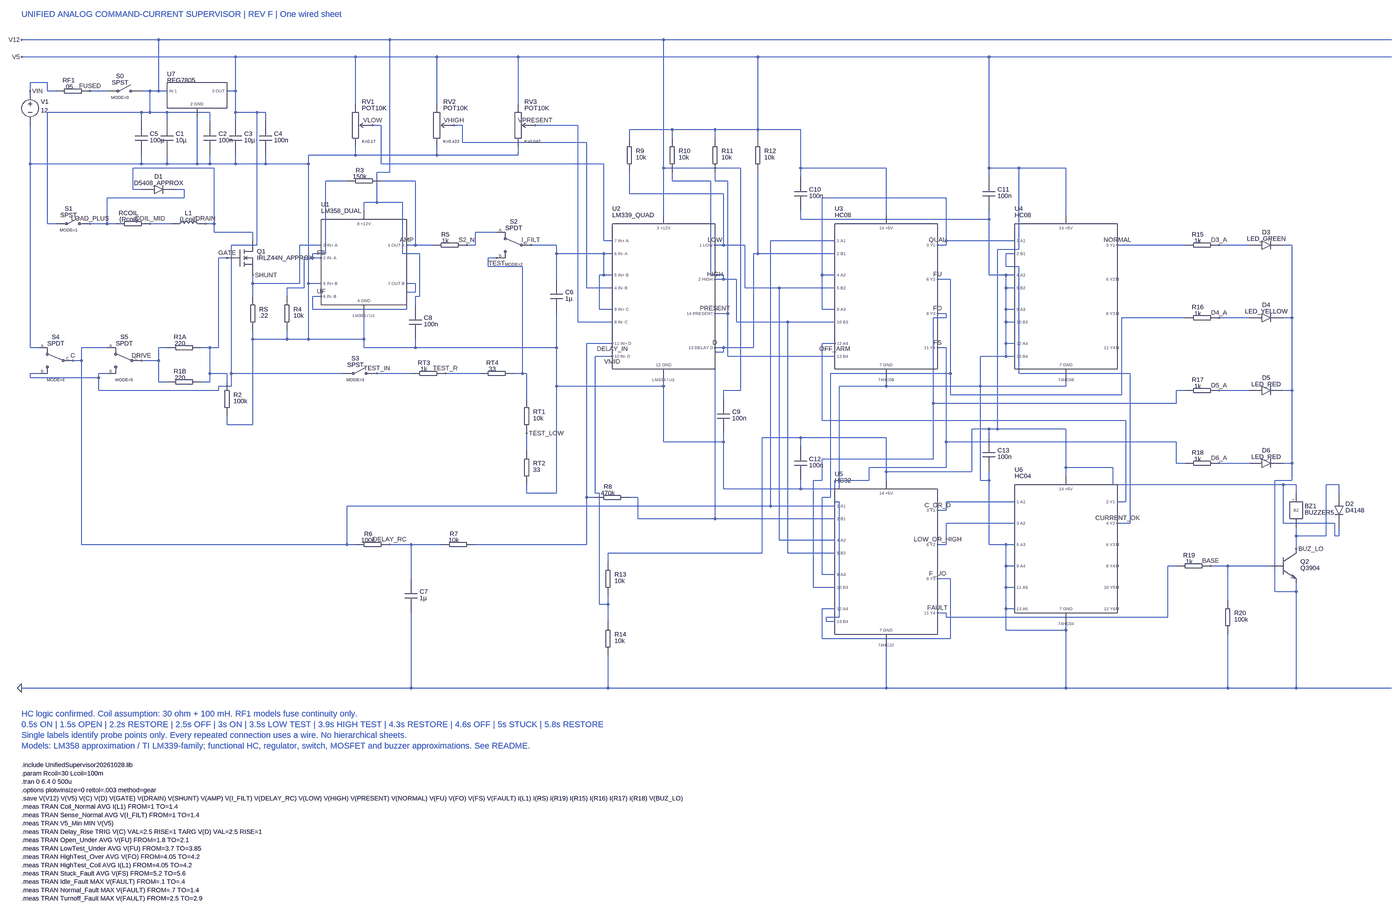
[diagram p0: schematic Unified_Supervisor.asc, whole sheet]
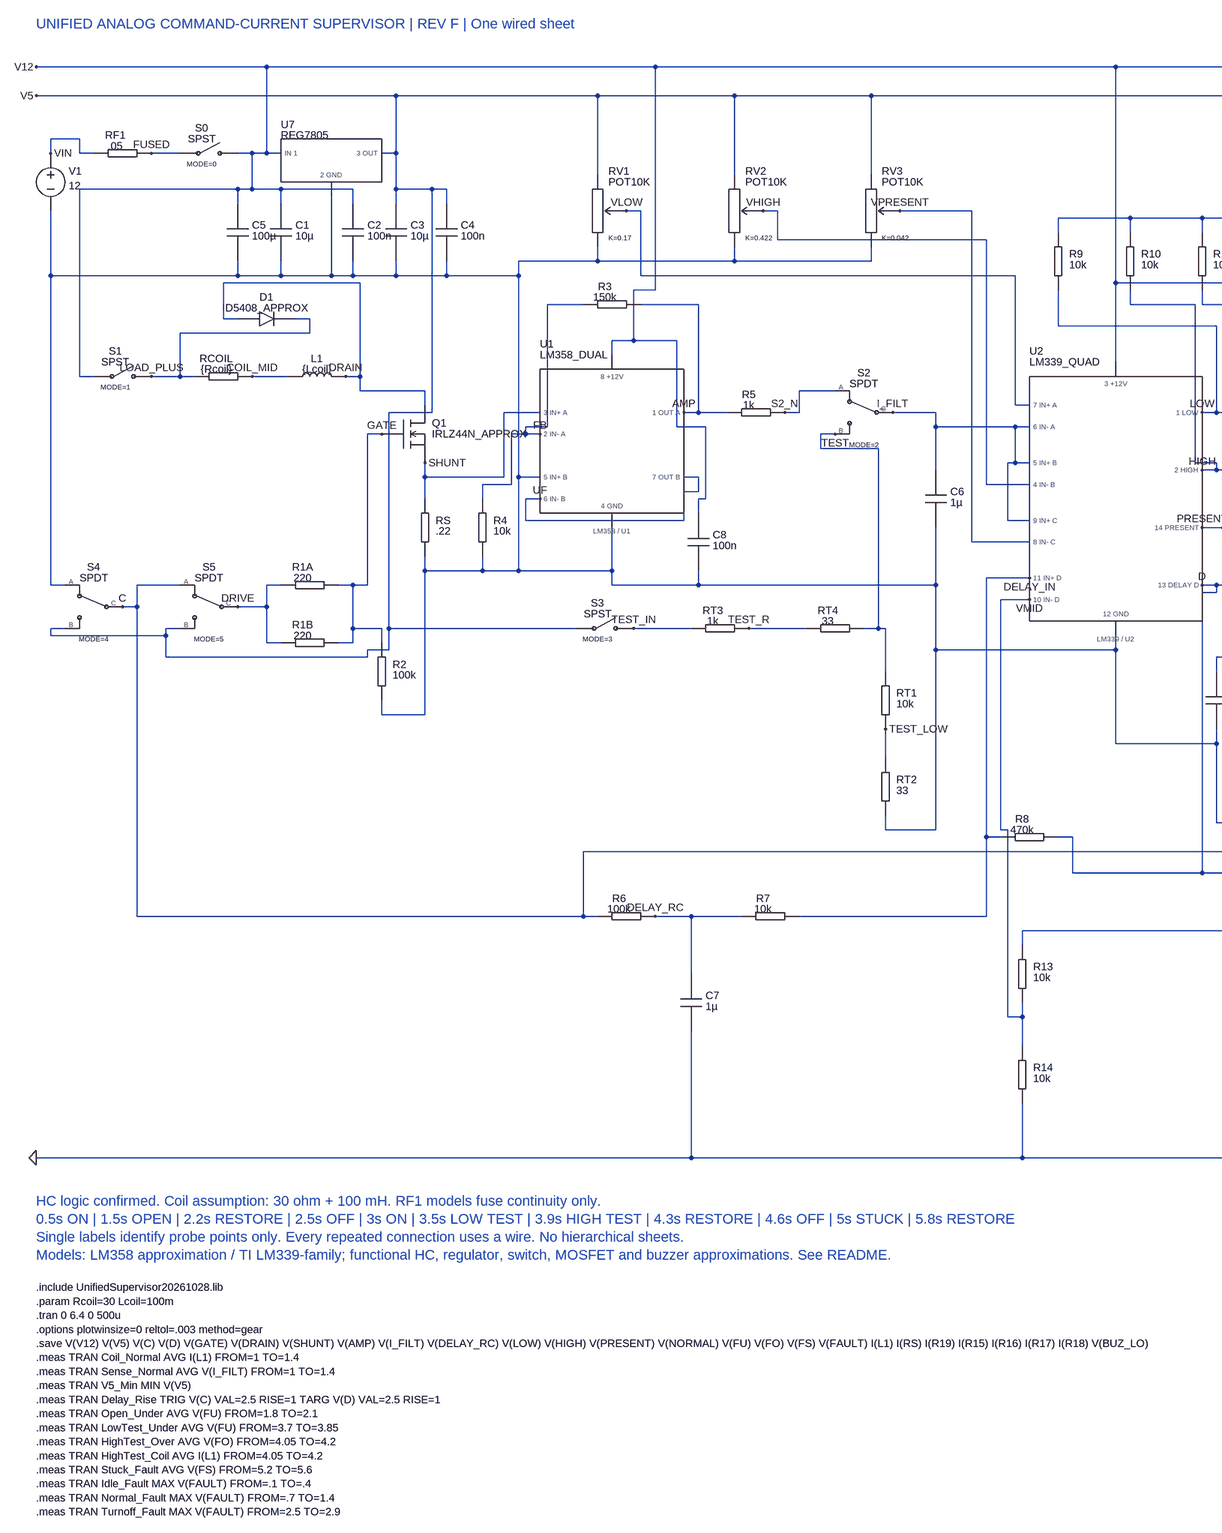
[diagram p1: schematic Unified_Supervisor.asc, part, row 1 of 1, column 1 of 2]
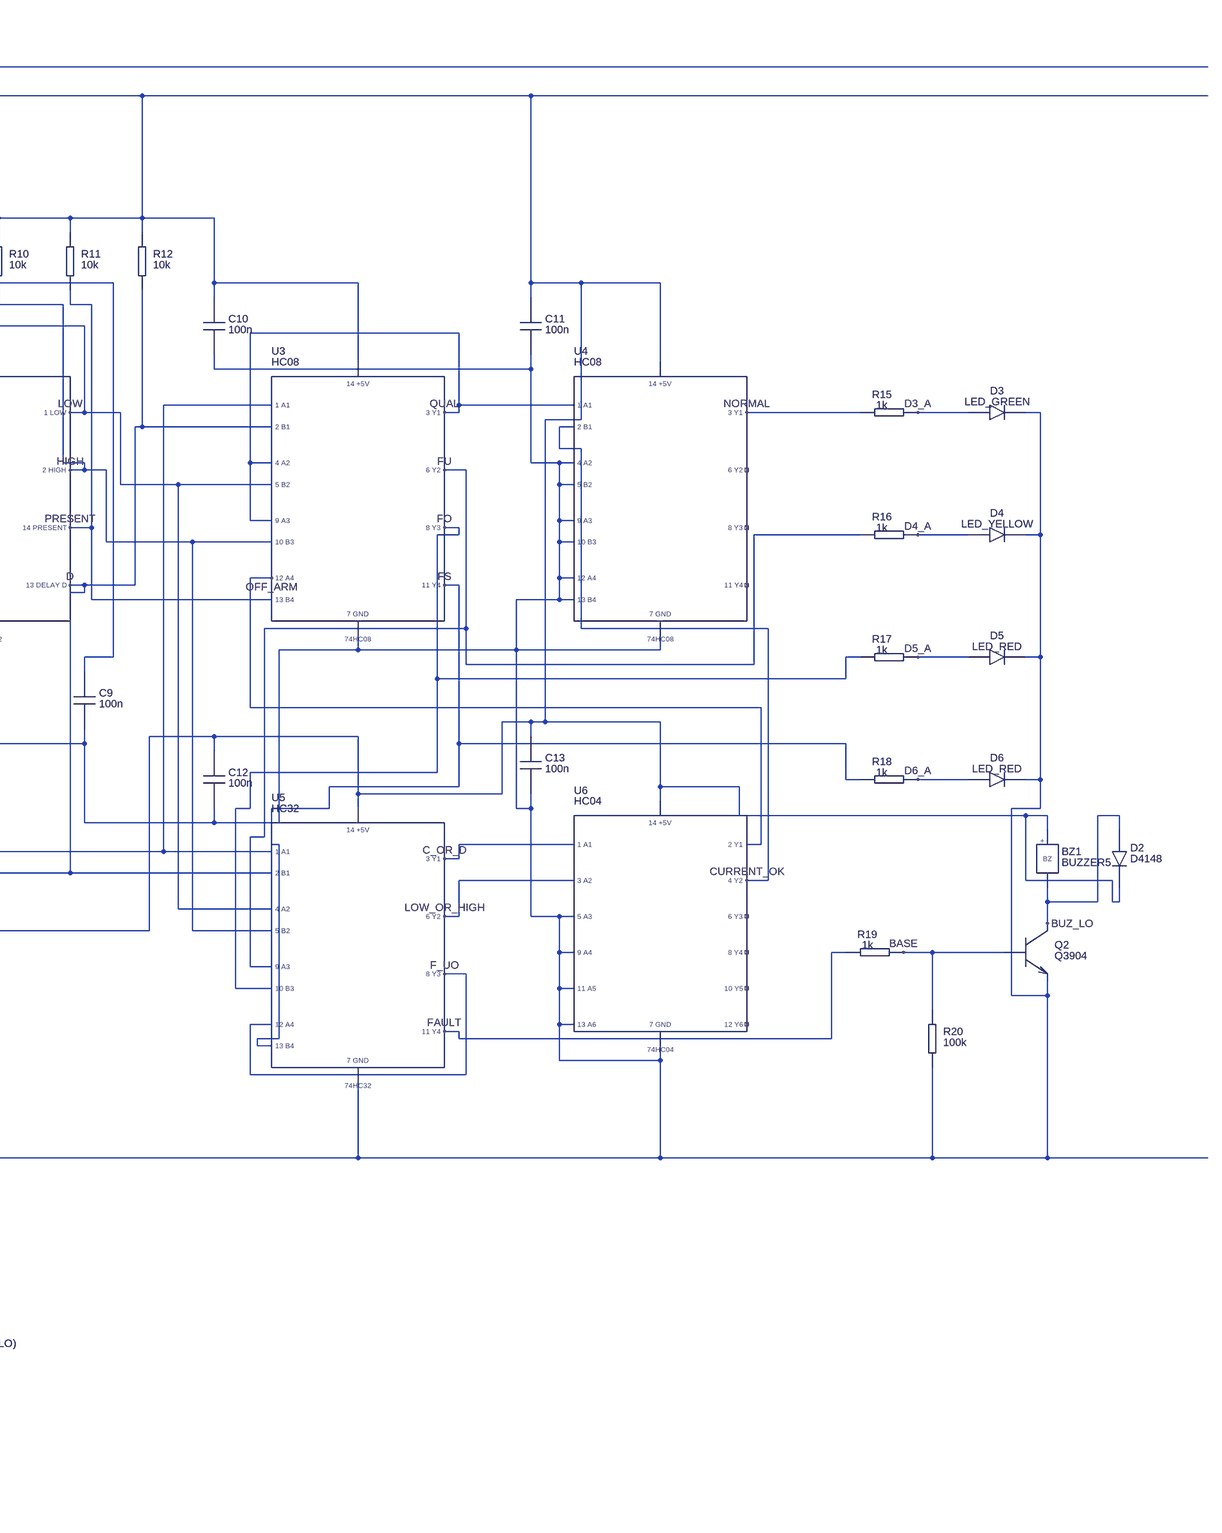
[diagram p2: schematic Unified_Supervisor.asc, part, row 1 of 1, column 2 of 2]
Unified_Supervisor.asc, the LTspice schematic file:
Version 4
SHEET 1 5280 3280
WIRE 544 96 32 96
WIRE 1408 96 544 96
WIRE 2432 96 1408 96
WIRE 5168 96 2432 96
WIRE 832 160 32 160
WIRE 1280 160 832 160
WIRE 1584 160 1280 160
WIRE 1888 160 1584 160
WIRE 2784 160 1888 160
WIRE 3648 160 2784 160
WIRE 5168 160 3648 160
WIRE 128 256 64 256
WIRE 64 288 64 256
WIRE 128 288 128 256
WIRE 160 288 128 288
WIRE 352 288 288 288
WIRE 512 288 480 288
WIRE 544 288 544 96
WIRE 544 288 512 288
WIRE 576 288 544 288
WIRE 832 288 832 160
WIRE 832 288 800 288
WIRE 1280 336 1280 160
WIRE 1584 336 1584 160
WIRE 1888 336 1888 160
WIRE 480 368 128 368
WIRE 512 368 512 288
WIRE 512 368 480 368
WIRE 576 368 512 368
WIRE 736 368 576 368
WIRE 832 368 832 288
WIRE 912 368 832 368
WIRE 944 368 912 368
WIRE 480 400 480 368
WIRE 576 400 576 368
WIRE 736 400 736 368
WIRE 832 400 832 368
WIRE 944 400 944 368
WIRE 1376 416 1344 416
WIRE 1680 416 1648 416
WIRE 2112 416 1952 416
WIRE 2464 432 2304 432
WIRE 2624 432 2464 432
WIRE 2784 432 2784 160
WIRE 2784 432 2624 432
WIRE 2944 432 2784 432
WIRE 2304 464 2304 432
WIRE 2464 464 2464 432
WIRE 2624 464 2624 432
WIRE 2784 464 2784 432
WIRE 1680 480 1680 416
WIRE 2144 480 1680 480
WIRE 1280 528 1280 496
WIRE 1280 528 1104 528
WIRE 1584 528 1584 496
WIRE 1584 528 1280 528
WIRE 1888 528 1888 496
WIRE 1888 528 1584 528
WIRE 64 560 64 416
WIRE 480 560 480 528
WIRE 480 560 64 560
WIRE 576 560 576 528
WIRE 576 560 480 560
WIRE 688 560 688 384
WIRE 688 560 576 560
WIRE 736 560 736 528
WIRE 736 560 688 560
WIRE 832 560 832 528
WIRE 832 560 736 560
WIRE 944 560 944 528
WIRE 944 560 832 560
WIRE 1104 560 1104 528
WIRE 1104 560 944 560
WIRE 1376 560 1376 416
WIRE 2208 560 1376 560
WIRE 752 576 448 576
WIRE 2432 576 2432 96
WIRE 2720 576 2432 576
WIRE 2944 576 2944 432
WIRE 3264 576 2944 576
WIRE 3648 576 3648 160
WIRE 3760 576 3648 576
WIRE 3936 576 3760 576
WIRE 1408 592 1408 96
WIRE 1408 592 1360 592
WIRE 2944 608 2944 576
WIRE 3648 608 3648 576
WIRE 1248 624 1168 624
WIRE 1504 624 1376 624
WIRE 2464 624 2464 592
WIRE 2608 624 2464 624
WIRE 2624 624 2624 592
WIRE 2672 624 2624 624
WIRE 448 656 448 576
WIRE 480 656 448 656
WIRE 640 656 608 656
WIRE 2304 672 2304 592
WIRE 2656 672 2304 672
WIRE 640 688 640 656
WIRE 640 688 352 688
WIRE 3488 688 3024 688
WIRE 1360 704 1360 592
WIRE 1360 704 1312 704
WIRE 1456 704 1360 704
WIRE 1312 736 1312 704
WIRE 2432 752 2432 576
WIRE 3264 752 3264 576
WIRE 3936 752 3936 576
WIRE 2944 768 2944 736
WIRE 3648 768 3648 736
WIRE 3648 768 2944 768
WIRE 128 784 128 368
WIRE 160 784 128 784
WIRE 352 784 352 688
WIRE 352 784 288 784
WIRE 384 784 352 784
WIRE 592 784 512 784
WIRE 752 784 752 576
WIRE 752 784 720 784
WIRE 752 816 752 784
WIRE 896 816 752 816
WIRE 1808 816 1728 816
WIRE 896 848 896 816
WIRE 2208 848 2208 560
WIRE 2240 848 2208 848
WIRE 3072 848 2832 848
WIRE 3488 848 3488 688
WIRE 3744 848 3488 848
WIRE 912 864 912 368
WIRE 912 864 816 864
WIRE 1152 864 1072 864
WIRE 1504 864 1504 624
WIRE 1504 864 1472 864
WIRE 1568 864 1504 864
WIRE 1728 864 1728 816
WIRE 1728 864 1696 864
WIRE 2032 864 1936 864
WIRE 2656 864 2656 672
WIRE 2656 864 2624 864
WIRE 2736 864 2656 864
WIRE 3488 864 3488 848
WIRE 3488 864 3456 864
WIRE 4384 864 4128 864
WIRE 4624 864 4512 864
WIRE 4784 864 4752 864
WIRE 3760 880 3760 576
WIRE 3760 880 3680 880
WIRE 1168 896 1168 624
WIRE 1168 896 1120 896
WIRE 1456 896 1456 704
WIRE 1520 896 1456 896
WIRE 2032 896 2032 864
WIRE 2208 896 2032 896
WIRE 2240 896 2208 896
WIRE 2784 896 2784 592
WIRE 2784 896 2768 896
WIRE 3072 896 2784 896
WIRE 3744 896 3712 896
WIRE 800 912 768 912
WIRE 1120 912 1120 896
WIRE 1120 912 1088 912
WIRE 1152 912 1120 912
WIRE 1808 912 1776 912
WIRE 1776 944 1776 912
WIRE 1904 944 1776 944
WIRE 3712 944 3712 896
WIRE 3760 944 3712 944
WIRE 2208 976 2208 896
WIRE 2208 976 2192 976
WIRE 2240 976 2208 976
WIRE 2608 976 2608 624
WIRE 2656 976 2608 976
WIRE 3024 976 3024 688
WIRE 3072 976 3024 976
WIRE 3648 976 3648 768
WIRE 3712 976 3648 976
WIRE 3744 976 3712 976
WIRE 2032 992 2032 896
WIRE 2656 992 2656 976
WIRE 2656 992 2624 992
WIRE 2704 992 2656 992
WIRE 3504 992 3456 992
WIRE 896 1008 896 976
WIRE 1072 1008 1072 864
WIRE 1072 1008 896 1008
WIRE 1104 1008 1104 560
WIRE 1152 1008 1104 1008
WIRE 1504 1008 1472 1008
WIRE 1088 1024 1088 912
WIRE 1088 1024 1024 1024
WIRE 2144 1024 2144 480
WIRE 2240 1024 2144 1024
WIRE 2736 1024 2736 864
WIRE 2864 1024 2736 1024
WIRE 3072 1024 2864 1024
WIRE 3712 1024 3712 976
WIRE 3744 1024 3712 1024
WIRE 1504 1040 1504 1008
WIRE 1504 1040 1472 1040
WIRE 896 1056 896 1008
WIRE 1024 1056 1024 1024
WIRE 1152 1056 1120 1056
WIRE 1520 1056 1520 896
WIRE 1520 1056 1504 1056
WIRE 1504 1088 1504 1056
WIRE 1120 1104 1120 1056
WIRE 1472 1104 1472 1040
WIRE 1472 1104 1120 1104
WIRE 2192 1104 2192 976
WIRE 2240 1104 2192 1104
WIRE 3024 1104 3024 976
WIRE 3072 1104 3024 1104
WIRE 3712 1104 3712 1024
WIRE 3744 1104 3712 1104
WIRE 2672 1120 2672 624
WIRE 2672 1120 2624 1120
WIRE 3488 1120 3456 1120
WIRE 3488 1136 3488 1120
WIRE 3488 1136 3440 1136
WIRE 4384 1136 4144 1136
WIRE 4624 1136 4512 1136
WIRE 4784 1136 4784 864
WIRE 4784 1136 4752 1136
WIRE 2112 1152 2112 416
WIRE 2240 1152 2112 1152
WIRE 2704 1152 2704 992
WIRE 2896 1152 2704 1152
WIRE 3072 1152 2896 1152
WIRE 3712 1152 3712 1104
WIRE 3744 1152 3712 1152
WIRE 896 1216 896 1184
WIRE 1024 1216 1024 1184
WIRE 1024 1216 896 1216
WIRE 1104 1216 1104 1008
WIRE 1104 1216 1024 1216
WIRE 1312 1216 1312 1120
WIRE 1312 1216 1104 1216
WIRE 2240 1232 2144 1232
WIRE 3072 1232 3024 1232
WIRE 3712 1232 3712 1152
WIRE 3744 1232 3712 1232
WIRE 64 1248 64 560
WIRE 96 1248 64 1248
WIRE 352 1248 256 1248
WIRE 576 1248 544 1248
WIRE 736 1248 704 1248
WIRE 768 1248 768 912
WIRE 768 1248 736 1248
WIRE 1312 1248 1312 1216
WIRE 1504 1248 1504 1216
WIRE 1504 1248 1312 1248
WIRE 2032 1248 2032 1120
WIRE 2032 1248 1504 1248
WIRE 2656 1248 2624 1248
WIRE 2768 1248 2768 896
WIRE 2768 1248 2656 1248
WIRE 3488 1248 3456 1248
WIRE 2656 1264 2656 1248
WIRE 2656 1264 2624 1264
WIRE 2240 1280 2176 1280
WIRE 2672 1280 2672 1120
WIRE 3072 1280 2672 1280
WIRE 3712 1280 3712 1232
WIRE 3712 1280 3616 1280
WIRE 3744 1280 3712 1280
WIRE 256 1296 256 1248
WIRE 256 1296 224 1296
WIRE 544 1296 544 1248
WIRE 544 1296 480 1296
WIRE 96 1344 64 1344
WIRE 352 1344 320 1344
WIRE 736 1344 736 1248
WIRE 800 1344 736 1344
WIRE 816 1344 816 864
WIRE 1232 1344 816 1344
WIRE 1488 1344 1360 1344
WIRE 1744 1344 1616 1344
WIRE 1904 1344 1904 944
WIRE 1904 1344 1872 1344
WIRE 1920 1344 1904 1344
WIRE 3504 1344 3504 992
WIRE 3504 1344 3056 1344
WIRE 3760 1344 3760 944
WIRE 4176 1344 3760 1344
WIRE 64 1360 64 1344
WIRE 320 1360 320 1344
WIRE 320 1360 64 1360
WIRE 544 1376 544 1296
WIRE 576 1376 544 1376
WIRE 736 1376 736 1344
WIRE 736 1376 704 1376
WIRE 800 1376 800 1344
WIRE 816 1392 816 1344
WIRE 816 1392 768 1392
WIRE 2032 1392 2032 1248
WIRE 2432 1392 2432 1360
WIRE 2432 1392 2032 1392
WIRE 3264 1392 3264 1360
WIRE 3264 1392 3088 1392
WIRE 3616 1392 3616 1280
WIRE 3616 1392 3264 1392
WIRE 3936 1392 3936 1360
WIRE 3936 1392 3616 1392
WIRE 320 1408 320 1360
WIRE 768 1408 768 1392
WIRE 768 1408 320 1408
WIRE 2720 1408 2720 576
WIRE 2720 1408 2656 1408
WIRE 4384 1408 4352 1408
WIRE 4624 1408 4512 1408
WIRE 4784 1408 4784 1136
WIRE 4784 1408 4752 1408
WIRE 3504 1424 3504 1344
WIRE 4144 1424 4144 1136
WIRE 4144 1424 3504 1424
WIRE 1920 1440 1920 1344
WIRE 2656 1440 2656 1408
WIRE 3440 1456 3440 1136
WIRE 4352 1456 4352 1408
WIRE 4352 1456 3440 1456
WIRE 3024 1520 3024 1232
WIRE 4160 1520 3024 1520
WIRE 800 1536 800 1504
WIRE 896 1536 896 1216
WIRE 896 1536 800 1536
WIRE 3648 1552 3584 1552
WIRE 3680 1552 3680 880
WIRE 3680 1552 3648 1552
WIRE 3936 1552 3680 1552
WIRE 2944 1584 2800 1584
WIRE 3264 1584 2944 1584
WIRE 3648 1584 3648 1552
WIRE 2432 1600 2432 1392
WIRE 2656 1600 2656 1568
WIRE 2656 1600 2432 1600
WIRE 3488 1600 3488 1248
WIRE 4352 1600 3488 1600
WIRE 2944 1616 2944 1584
WIRE 1920 1632 1920 1568
WIRE 3440 1664 3440 1456
WIRE 3440 1664 3024 1664
WIRE 4352 1680 4352 1600
WIRE 4384 1680 4352 1680
WIRE 4624 1680 4512 1680
WIRE 4784 1680 4784 1408
WIRE 4784 1680 4752 1680
WIRE 3488 1696 3488 1600
WIRE 3488 1696 3200 1696
WIRE 3936 1696 3936 1552
WIRE 4112 1696 3936 1696
WIRE 3264 1712 3264 1584
WIRE 3584 1712 3584 1552
WIRE 3584 1712 3264 1712
WIRE 3936 1728 3936 1696
WIRE 3024 1744 3024 1664
WIRE 3024 1744 2992 1744
WIRE 3200 1744 3200 1696
WIRE 3200 1744 3072 1744
WIRE 3264 1744 3264 1712
WIRE 3616 1744 3616 1392
WIRE 3648 1744 3648 1712
WIRE 3648 1744 3616 1744
WIRE 4784 1744 4784 1680
WIRE 4784 1744 4720 1744
WIRE 4112 1760 4112 1696
WIRE 4752 1760 4112 1760
WIRE 4800 1760 4752 1760
WIRE 4960 1760 4912 1760
WIRE 2656 1776 2656 1600
WIRE 2944 1776 2944 1744
WIRE 2944 1776 2656 1776
WIRE 3088 1776 3088 1392
WIRE 3088 1776 2944 1776
WIRE 1920 1792 1920 1760
WIRE 2032 1792 2032 1392
WIRE 2032 1792 1920 1792
WIRE 2176 1792 2176 1280
WIRE 2192 1792 2176 1792
WIRE 4800 1792 4800 1760
WIRE 4960 1792 4960 1760
WIRE 2144 1808 2144 1232
WIRE 2176 1808 2144 1808
WIRE 2336 1808 2304 1808
WIRE 3056 1808 3056 1344
WIRE 3056 1808 3024 1808
WIRE 3072 1824 3072 1744
WIRE 3088 1824 3072 1824
WIRE 3744 1824 3488 1824
WIRE 4160 1824 4160 1520
WIRE 4160 1824 4128 1824
WIRE 2832 1840 2832 848
WIRE 2832 1840 1248 1840
WIRE 3072 1840 2832 1840
WIRE 3488 1856 3488 1824
WIRE 3488 1856 3456 1856
WIRE 2336 1888 2336 1808
WIRE 2624 1888 2624 1264
WIRE 2624 1888 2336 1888
WIRE 3072 1888 2624 1888
WIRE 3744 1904 3488 1904
WIRE 4176 1904 4176 1344
WIRE 4176 1904 4128 1904
WIRE 4752 1904 4752 1760
WIRE 4944 1904 4752 1904
WIRE 4800 1952 4800 1920
WIRE 4912 1952 4912 1760
WIRE 4912 1952 4800 1952
WIRE 4944 1952 4944 1904
WIRE 4960 1952 4960 1920
WIRE 4960 1952 4944 1952
WIRE 2864 1968 2864 1024
WIRE 3072 1968 2864 1968
WIRE 256 1984 256 1296
WIRE 1248 1984 1248 1840
WIRE 1248 1984 256 1984
WIRE 1280 1984 1248 1984
WIRE 1488 1984 1408 1984
WIRE 1600 1984 1488 1984
WIRE 2144 1984 2144 1808
WIRE 2144 1984 1728 1984
WIRE 3488 1984 3488 1904
WIRE 3488 1984 3456 1984
WIRE 3648 1984 3648 1744
WIRE 3712 1984 3648 1984
WIRE 3744 1984 3712 1984
WIRE 4800 2000 4800 1952
WIRE 2800 2016 2800 1584
WIRE 2800 2016 2224 2016
WIRE 2896 2016 2896 1152
WIRE 3072 2016 2896 2016
WIRE 2224 2048 2224 2016
WIRE 3712 2064 3712 1984
WIRE 3744 2064 3712 2064
WIRE 4352 2064 4320 2064
WIRE 4544 2064 4480 2064
WIRE 4704 2064 4544 2064
WIRE 3024 2096 3024 1808
WIRE 3072 2096 3024 2096
WIRE 1488 2112 1488 1984
WIRE 3504 2112 3456 2112
WIRE 2992 2144 2992 1744
WIRE 3072 2144 2992 2144
WIRE 3712 2144 3712 2064
WIRE 3744 2144 3712 2144
WIRE 4720 2160 4720 1744
WIRE 4800 2160 4800 2128
WIRE 4800 2160 4720 2160
WIRE 4544 2192 4544 2064
WIRE 2192 2208 2192 1792
WIRE 2224 2208 2224 2176
WIRE 2224 2208 2192 2208
WIRE 3072 2224 3024 2224
WIRE 3712 2224 3712 2144
WIRE 3744 2224 3712 2224
WIRE 3488 2240 3456 2240
WIRE 3088 2256 3088 1824
WIRE 3088 2256 3040 2256
WIRE 3488 2256 3488 2240
WIRE 4320 2256 4320 2064
WIRE 4320 2256 3488 2256
WIRE 2224 2272 2224 2208
WIRE 3040 2272 3040 2256
WIRE 3072 2272 3040 2272
WIRE 3712 2304 3712 2224
WIRE 3936 2304 3936 2272
WIRE 3936 2304 3712 2304
WIRE 3024 2336 3024 2224
WIRE 3504 2336 3504 2112
WIRE 3504 2336 3024 2336
WIRE 1488 2624 1488 2240
WIRE 1488 2624 32 2624
WIRE 2224 2624 2224 2400
WIRE 2224 2624 1488 2624
WIRE 3264 2624 3264 2352
WIRE 3264 2624 2224 2624
WIRE 3936 2624 3936 2304
WIRE 3936 2624 3264 2624
WIRE 4544 2624 4544 2320
WIRE 4544 2624 3936 2624
WIRE 4800 2624 4800 2160
WIRE 4800 2624 4544 2624
WIRE 5168 2624 4800 2624
FLAG 32 2624 0
FLAG 288 288 FUSED
FLAG 1920 1568 TEST_LOW
FLAG 512 784 COIL_MID
FLAG 64 288 VIN
FLAG 4512 864 D3_A
FLAG 4512 1136 D4_A
FLAG 4512 1408 D5_A
FLAG 4512 1680 D6_A
FLAG 1360 1344 TEST_IN
FLAG 1616 1344 TEST_R
FLAG 1696 864 S2_N
FLAG 4128 864 NORMAL
FLAG 3456 1856 C_OR_D
FLAG 1152 1056 UF
FLAG 3456 1984 LOW_OR_HIGH
FLAG 3456 2112 F_UO
FLAG 1952 416 VPRESENT
FLAG 3456 2240 FAULT
FLAG 1648 416 VHIGH
FLAG 1344 416 VLOW
FLAG 4128 1904 CURRENT_OK
FLAG 3072 1232 OFF_ARM
FLAG 480 1296 DRIVE
FLAG 1408 1984 DELAY_RC
FLAG 4480 2064 BASE
FLAG 1472 864 AMP
FLAG 896 976 SHUNT
FLAG 4800 2000 BUZ_LO
FLAG 288 784 LOAD_PLUS
FLAG 720 784 DRAIN
FLAG 1152 912 FB
FLAG 1808 912 TEST
FLAG 2624 1120 PRESENT
FLAG 2240 1232 DELAY_IN
FLAG 2240 1280 VMID
FLAG 3456 992 FU
FLAG 3456 1120 FO
FLAG 3456 1248 FS
FLAG 3456 864 QUAL
FLAG 800 912 GATE
FLAG 2624 992 HIGH
FLAG 2624 864 LOW
FLAG 1936 864 I_FILT
FLAG 2624 1248 D
FLAG 224 1296 C
FLAG 32 96 V12
FLAG 32 160 V5
SYMBOL Supply 64 288 R0
SYMATTR InstName V1
SYMATTR Value 12
SYMBOL RH 160 288 R0
SYMATTR InstName RF1
SYMATTR Value .05
SYMBOL SPST 352 288 R0
SYMATTR InstName S0
SYMATTR SpiceLine MODE=0
SYMBOL Reg 576 256 R0
SYMATTR InstName U7
SYMATTR Value REG7805
SYMBOL CV 480 400 R0
SYMATTR InstName C5
SYMATTR Value 100µ
SYMBOL CV 576 400 R0
SYMATTR InstName C1
SYMATTR Value 10µ
SYMBOL CV 736 400 R0
SYMATTR InstName C2
SYMATTR Value 100n
SYMBOL CV 832 400 R0
SYMATTR InstName C3
SYMATTR Value 10µ
SYMBOL CV 944 400 R0
SYMATTR InstName C4
SYMATTR Value 100n
SYMBOL SPST 160 784 R0
SYMATTR InstName S1
SYMATTR SpiceLine MODE=1
SYMBOL RH 384 784 R0
SYMATTR InstName RCOIL
SYMATTR Value {Rcoil}
SYMBOL Coil 592 784 R0
SYMATTR InstName L1
SYMATTR Value {Lcoil}
SYMBOL DH 480 656 R0
SYMATTR InstName D1
SYMATTR Value D5408_APPROX
SYMBOL MOS 800 848 R0
SYMATTR InstName Q1
SYMATTR Value IRLZ44N_APPROX
SYMBOL RV 896 1056 R0
SYMATTR InstName RS
SYMATTR Value .22
SYMBOL SPDT 96 1248 R0
SYMATTR InstName S4
SYMATTR SpiceLine MODE=4
SYMBOL SPDT 352 1248 R0
SYMATTR InstName S5
SYMATTR SpiceLine MODE=5
SYMBOL RH 576 1248 R0
SYMATTR InstName R1A
SYMATTR Value 220
SYMBOL RH 576 1376 R0
SYMATTR InstName R1B
SYMATTR Value 220
SYMBOL RV 800 1376 R0
SYMATTR InstName R2
SYMATTR Value 100k
SYMBOL LM358 1152 768 R0
SYMATTR InstName U1
SYMATTR Value LM358_DUAL
SYMBOL RH 1248 624 R0
SYMATTR InstName R3
SYMATTR Value 150k
SYMBOL RV 1024 1056 R0
SYMATTR InstName R4
SYMATTR Value 10k
SYMBOL CV 1504 1088 R0
SYMATTR InstName C8
SYMATTR Value 100n
SYMBOL RH 1568 864 R0
SYMATTR InstName R5
SYMATTR Value 1k
SYMBOL SPDT 1808 816 R0
SYMATTR InstName S2
SYMATTR SpiceLine MODE=2
SYMBOL CV 2032 992 R0
SYMATTR InstName C6
SYMATTR Value 1µ
SYMBOL SPST 1232 1344 R0
SYMATTR InstName S3
SYMATTR SpiceLine MODE=3
SYMBOL RH 1488 1344 R0
SYMATTR InstName RT3
SYMATTR Value 1k
SYMBOL RH 1744 1344 R0
SYMATTR InstName RT4
SYMATTR Value 33
SYMBOL RV 1920 1440 R0
SYMATTR InstName RT1
SYMATTR Value 10k
SYMBOL RV 1920 1632 R0
SYMATTR InstName RT2
SYMATTR Value 33
SYMBOL POT 1280 336 R0
SYMATTR InstName RV1
SYMATTR Value POT10K
SYMATTR SpiceLine K=0.17
SYMBOL POT 1584 336 R0
SYMATTR InstName RV2
SYMATTR Value POT10K
SYMATTR SpiceLine K=0.422
SYMBOL POT 1888 336 R0
SYMATTR InstName RV3
SYMATTR Value POT10K
SYMATTR SpiceLine K=0.042
SYMBOL LM339 2240 784 R0
SYMATTR InstName U2
SYMATTR Value LM339_QUAD
SYMBOL RV 2304 464 R0
SYMATTR InstName R9
SYMATTR Value 10k
SYMBOL RV 2464 464 R0
SYMATTR InstName R10
SYMATTR Value 10k
SYMBOL RV 2624 464 R0
SYMATTR InstName R11
SYMATTR Value 10k
SYMBOL RV 2784 464 R0
SYMATTR InstName R12
SYMATTR Value 10k
SYMBOL CV 2656 1440 R0
SYMATTR InstName C9
SYMATTR Value 100n
SYMBOL RH 1280 1984 R0
SYMATTR InstName R6
SYMATTR Value 100k
SYMBOL CV 1488 2112 R0
SYMATTR InstName C7
SYMATTR Value 1µ
SYMBOL RH 1600 1984 R0
SYMATTR InstName R7
SYMATTR Value 10k
SYMBOL RH 2176 1808 R0
SYMATTR InstName R8
SYMATTR Value 470k
SYMBOL RV 2224 2048 R0
SYMATTR InstName R13
SYMATTR Value 10k
SYMBOL RV 2224 2272 R0
SYMATTR InstName R14
SYMATTR Value 10k
SYMBOL HC08 3072 784 R0
SYMATTR InstName U3
SYMBOL HC32 3072 1776 R0
SYMATTR InstName U5
SYMBOL HC04 3744 1760 R0
SYMATTR InstName U6
SYMBOL HC08 3744 784 R0
SYMATTR InstName U4
SYMBOL CV 2944 608 R0
SYMATTR InstName C10
SYMATTR Value 100n
SYMBOL CV 3648 608 R0
SYMATTR InstName C11
SYMATTR Value 100n
SYMBOL CV 2944 1616 R0
SYMATTR InstName C12
SYMATTR Value 100n
SYMBOL CV 3648 1584 R0
SYMATTR InstName C13
SYMATTR Value 100n
SYMBOL RH 4384 864 R0
SYMATTR InstName R15
SYMATTR Value 1k
SYMBOL DH 4624 864 R0
SYMATTR InstName D3
SYMATTR Value LED_GREEN
SYMBOL RH 4384 1136 R0
SYMATTR InstName R16
SYMATTR Value 1k
SYMBOL DH 4624 1136 R0
SYMATTR InstName D4
SYMATTR Value LED_YELLOW
SYMBOL RH 4384 1408 R0
SYMATTR InstName R17
SYMATTR Value 1k
SYMBOL DH 4624 1408 R0
SYMATTR InstName D5
SYMATTR Value LED_RED
SYMBOL RH 4384 1680 R0
SYMATTR InstName R18
SYMATTR Value 1k
SYMBOL DH 4624 1680 R0
SYMATTR InstName D6
SYMATTR Value LED_RED
SYMBOL RH 4352 2064 R0
SYMATTR InstName R19
SYMATTR Value 1k
SYMBOL RV 4544 2192 R0
SYMATTR InstName R20
SYMATTR Value 100k
SYMBOL USNPN 4704 2000 R0
SYMATTR InstName Q2
SYMATTR Value Q3904
SYMBOL Buzzer 4800 1792 R0
SYMATTR InstName BZ1
SYMATTR Value BUZZER5
SYMBOL DV 4960 1792 R0
SYMATTR InstName D2
SYMATTR Value D4148
TEXT 32 0 Left 3 ;UNIFIED ANALOG COMMAND-CURRENT SUPERVISOR | REV F | One wired sheet
TEXT 32 2720 Left 3 ;HC logic confirmed. Coil assumption: 30 ohm + 100 mH. RF1 models fuse continuity only.
TEXT 32 2760 Left 3 ;0.5s ON | 1.5s OPEN | 2.2s RESTORE | 2.5s OFF | 3s ON | 3.5s LOW TEST | 3.9s HIGH TEST | 4.3s RESTORE | 4.6s OFF | 5s STUCK | 5.8s RESTORE
TEXT 32 2800 Left 3 ;Single labels identify probe points only. Every repeated connection uses a wire. No hierarchical sheets.
TEXT 32 2840 Left 3 ;Models: LM358 approximation / TI LM339-family; functional HC, regulator, switch, MOSFET and buzzer approximations. See README.
TEXT 32 2912 Left 2 !.include UnifiedSupervisor20261028.lib\n.param Rcoil=30 Lcoil=100m\n.tran 0 6.4 0 500u\n.options plotwinsize=0 reltol=.003 method=gear\n.save V(V12) V(V5) V(C) V(D) V(GATE) V(DRAIN) V(SHUNT) V(AMP) V(I_FILT) V(DELAY_RC) V(LOW) V(HIGH) V(PRESENT) V(NORMAL) V(FU) V(FO) V(FS) V(FAULT) I(L1) I(RS) I(R19) I(R15) I(R16) I(R17) I(R18) V(BUZ_LO)\n.meas TRAN Coil_Normal AVG I(L1) FROM=1 TO=1.4\n.meas TRAN Sense_Normal AVG V(I_FILT) FROM=1 TO=1.4\n.meas TRAN V5_Min MIN V(V5)\n.meas TRAN Delay_Rise TRIG V(C) VAL=2.5 RISE=1 TARG V(D) VAL=2.5 RISE=1\n.meas TRAN Open_Under AVG V(FU) FROM=1.8 TO=2.1\n.meas TRAN LowTest_Under AVG V(FU) FROM=3.7 TO=3.85\n.meas TRAN HighTest_Over AVG V(FO) FROM=4.05 TO=4.2\n.meas TRAN HighTest_Coil AVG I(L1) FROM=4.05 TO=4.2\n.meas TRAN Stuck_Fault AVG V(FS) FROM=5.2 TO=5.6\n.meas TRAN Idle_Fault MAX V(FAULT) FROM=.1 TO=.4\n.meas TRAN Normal_Fault MAX V(FAULT) FROM=.7 TO=1.4\n.meas TRAN Turnoff_Fault MAX V(FAULT) FROM=2.5 TO=2.9

The netlist it stands for:
* Unified_Supervisor.asc
V1 VIN 0 12
RF1 VIN FUSED .05
XS0 FUSED V12 SPST MODE=0  ; pins A B
XU7 V12 0 V5 REG7805  ; pins IN GND OUT
C5 V12 0 100µ
C1 V12 0 10µ
C2 V12 0 100n
C3 V5 0 10µ
C4 V5 0 100n
XS1 V12 LOAD_PLUS SPST MODE=1  ; pins A B
RCOIL LOAD_PLUS COIL_MID {Rcoil}
L1 COIL_MID DRAIN {Lcoil}
D1 DRAIN LOAD_PLUS D5408_APPROX
XQ1 DRAIN GATE SHUNT IRLZ44N_APPROX  ; pins D G S
RS SHUNT 0 .22
XS4 0 V5 C SPDT MODE=4  ; pins A B COM
XS5 C V5 DRIVE SPDT MODE=5  ; pins A B COM
R1A DRIVE GATE 220
R1B DRIVE GATE 220
R2 GATE 0 100k
XU1 AMP FB SHUNT 0 0 UF UF V12 LM358_DUAL  ; pins OUTA INA- INA+ GND INB+ INB- OUTB V+
R3 FB AMP 150k
R4 FB 0 10k
C8 V12 0 100n
R5 AMP S2_N 1k
XS2 S2_N TEST I_FILT SPDT MODE=2  ; pins A B COM
C6 I_FILT 0 1µ
XS3 V5 TEST_IN SPST MODE=3  ; pins A B
RT3 TEST_IN TEST_R 1k
RT4 TEST_R TEST 33
RT1 TEST TEST_LOW 10k
RT2 TEST_LOW 0 33
XRV1 V5 VLOW 0 POT10K K=0.17  ; pins TOP W BOT
XRV2 V5 VHIGH 0 POT10K K=0.422  ; pins TOP W BOT
XRV3 V5 VPRESENT 0 POT10K K=0.042  ; pins TOP W BOT
XU2 LOW HIGH V12 VHIGH I_FILT I_FILT VLOW VPRESENT I_FILT VMID DELAY_IN 0 D PRESENT LM339_QUAD  ; pins OUT1 OUT2 V+ IN2- IN2+ IN1- IN1+ IN3- IN3+ IN4- IN4+ GND OUT4 OUT3
R9 V5 LOW 10k
R10 V5 HIGH 10k
R11 V5 PRESENT 10k
R12 V5 D 10k
C9 V12 0 100n
R6 C DELAY_RC 100k
C7 DELAY_RC 0 1µ
R7 DELAY_RC DELAY_IN 10k
R8 DELAY_IN D 470k
R13 V5 VMID 10k
R14 VMID 0 10k
XU3 C D QUAL QUAL LOW FU 0 FO QUAL HIGH FS OFF_ARM PRESENT V5 HC08  ; pins 1A 1B 1Y 2A 2B 2Y GND 3Y 3A 3B 4Y 4A 4B VCC
XU5 C D C_OR_D LOW HIGH LOW_OR_HIGH 0 F_UO FU FO FAULT F_UO FS V5 HC32  ; pins 1A 1B 1Y 2A 2B 2Y GND 3Y 3A 3B 4Y 4A 4B VCC
XU6 C_OR_D OFF_ARM LOW_OR_HIGH CURRENT_OK 0 NC_01 0 NC_02 0 NC_03 0 NC_04 0 V5 HC04  ; pins 1A 1Y 2A 2Y 3A 3Y GND 4Y 4A 5Y 5A 6Y 6A VCC
XU4 QUAL CURRENT_OK NORMAL 0 0 NC_05 0 NC_06 0 0 NC_07 0 0 V5 HC08  ; pins 1A 1B 1Y 2A 2B 2Y GND 3Y 3A 3B 4Y 4A 4B VCC
C10 V5 0 100n
C11 V5 0 100n
C12 V5 0 100n
C13 V5 0 100n
R15 NORMAL D3_A 1k
D3 D3_A 0 LED_GREEN
R16 FU D4_A 1k
D4 D4_A 0 LED_YELLOW
R17 FO D5_A 1k
D5 D5_A 0 LED_RED
R18 FS D6_A 1k
D6 D6_A 0 LED_RED
R19 FAULT BASE 1k
R20 BASE 0 100k
Q2 BUZ_LO BASE 0 0 Q3904
XBZ1 V5 BUZ_LO BUZZER5  ; pins + -
D2 BUZ_LO V5 D4148
.model D D
.lib standard.dio
.model NPN NPN
.model PNP PNP
.lib standard.bjt
* UNIFIED ANALOG COMMAND-CURRENT SUPERVISOR | REV F | One wired sheet
* HC logic confirmed. Coil assumption: 30 ohm + 100 mH. RF1 models fuse continuity only.
* 0.5s ON | 1.5s OPEN | 2.2s RESTORE | 2.5s OFF | 3s ON | 3.5s LOW TEST | 3.9s HIGH TEST | 4.3s RESTORE | 4.6s OFF | 5s STUCK | 5.8s RESTORE
* Single labels identify probe points only. Every repeated connection uses a wire. No hierarchical sheets.
* Models: LM358 approximation / TI LM339-family; functional HC, regulator, switch, MOSFET and buzzer approximations. See README.
.include UnifiedSupervisor20261028.lib
.param Rcoil=30 Lcoil=100m
.tran 0 6.4 0 500u
.options plotwinsize=0 reltol=.003 method=gear
.save V(V12) V(V5) V(C) V(D) V(GATE) V(DRAIN) V(SHUNT) V(AMP) V(I_FILT) V(DELAY_RC) V(LOW) V(HIGH) V(PRESENT) V(NORMAL) V(FU) V(FO) V(FS) V(FAULT) I(L1) I(RS) I(R19) I(R15) I(R16) I(R17) I(R18) V(BUZ_LO)
.meas TRAN Coil_Normal AVG I(L1) FROM=1 TO=1.4
.meas TRAN Sense_Normal AVG V(I_FILT) FROM=1 TO=1.4
.meas TRAN V5_Min MIN V(V5)
.meas TRAN Delay_Rise TRIG V(C) VAL=2.5 RISE=1 TARG V(D) VAL=2.5 RISE=1
.meas TRAN Open_Under AVG V(FU) FROM=1.8 TO=2.1
.meas TRAN LowTest_Under AVG V(FU) FROM=3.7 TO=3.85
.meas TRAN HighTest_Over AVG V(FO) FROM=4.05 TO=4.2
.meas TRAN HighTest_Coil AVG I(L1) FROM=4.05 TO=4.2
.meas TRAN Stuck_Fault AVG V(FS) FROM=5.2 TO=5.6
.meas TRAN Idle_Fault MAX V(FAULT) FROM=.1 TO=.4
.meas TRAN Normal_Fault MAX V(FAULT) FROM=.7 TO=1.4
.meas TRAN Turnoff_Fault MAX V(FAULT) FROM=2.5 TO=2.9
.backanno
.end